# EasyEDA Pro project stopwatch.eprj, board PCB1
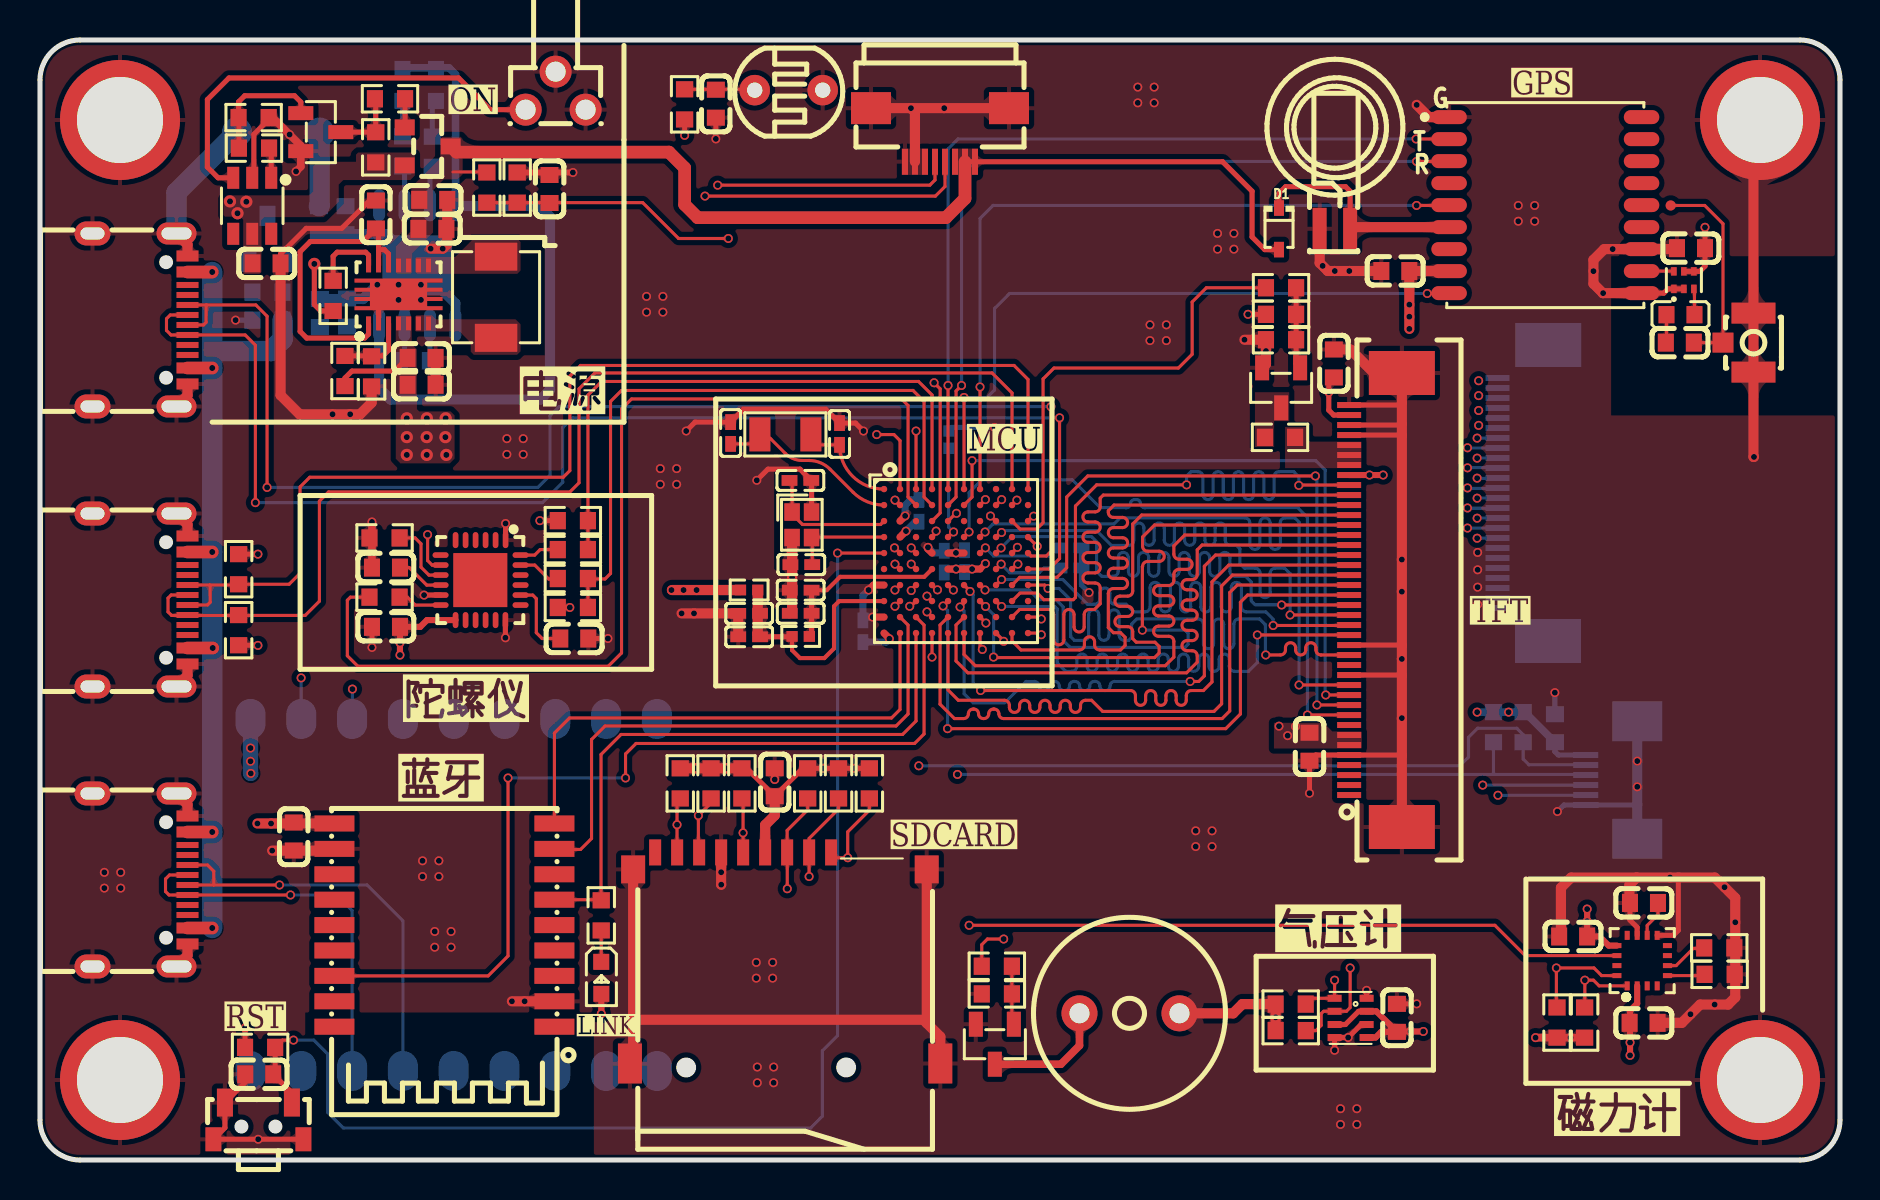
[diagram p3: board, top side]
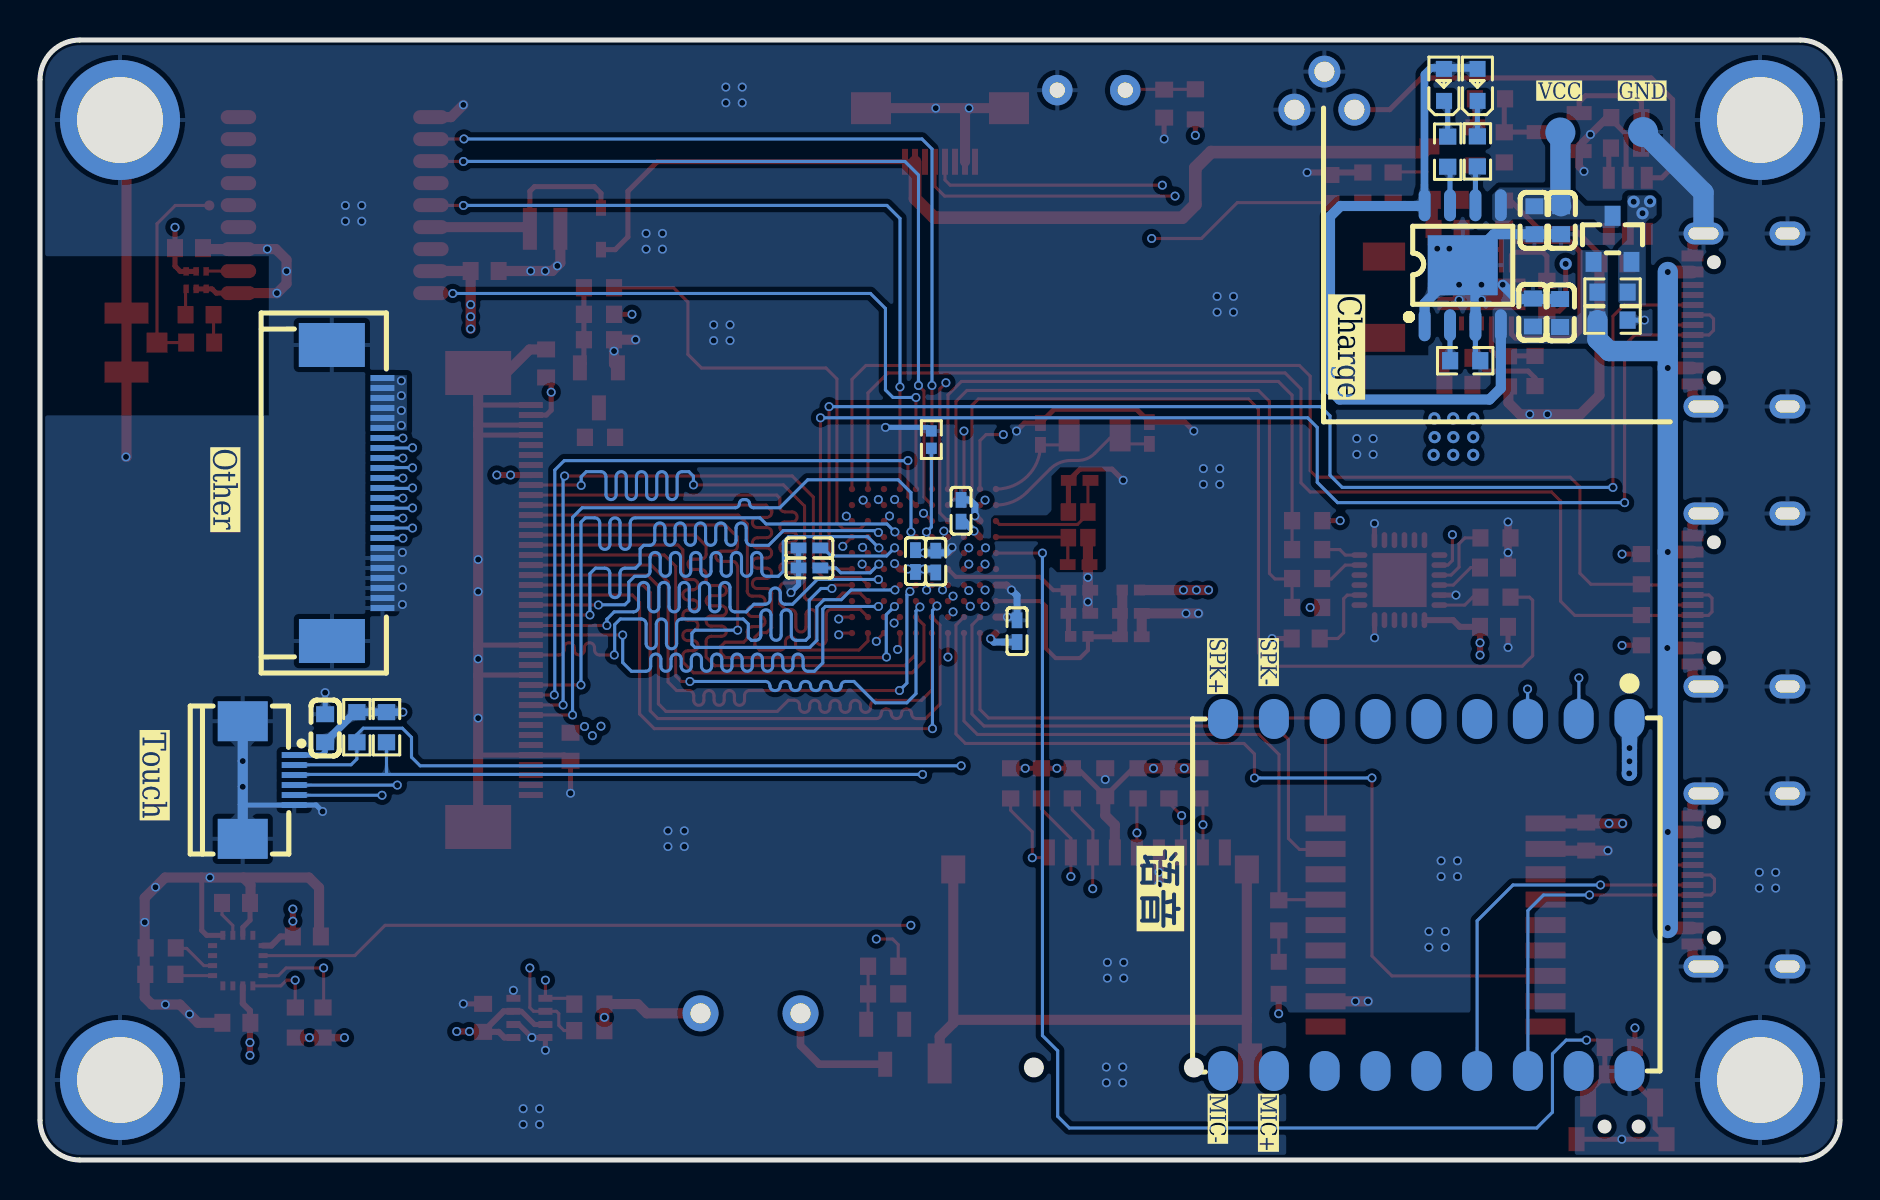
[diagram p4: board, bottom side, seen from below]

Outline 90 x 56 mm; copper layers: Top Layer, Inner1, Inner2, Inner3, Inner4, Bottom Layer. Coordinates in mm from the lower left corner of the outline.
Outline path: 0,54 0,2 arc(0.59,0.59) 2,0 88,0 arc(89.41,0.59) 90,2 90,54 arc(89.41,55.41) 88,56 2,56 arc(0.59,55.41) 0,54
Stack: Top Layer 0.035mm 外层铜厚1oz / Dielectric1 0.0994mm 3313 RC57% 4.2mil / Inner1 0.0152mm 内层铜厚 / Dielectric2 0.55mm 0.55mm H/H No copper / Inner2 0.0152mm 内层铜厚 / Dielectric3 0.1088mm 2116 RC54% 4.9mil / Inner3 0.0152mm 内层铜厚 / Dielectric4 0.55mm 0.55mm H/H No copper / Inner4 0.0152mm 内层铜厚 / Dielectric5 0.0994mm 3313 RC57% 4.2mil / Bottom Layer 0.035mm 外层铜厚1oz

## Design rules (mm)
template: 自定义配置
spacing copperThickness1oz (default): track to track 0.102, other pairs 0.089 to 0.3
spacing copperThickness2oz: track to track 0.203, other pairs 0.152 to 0.3
track width copperThickness1oz (default): min 0.102, default 0.155, max 2.54
track width copperThickness2oz: min 0.203, default 0.254, max 2.54
differential pair differentialPair (default): width min 0.127, default 0.254, max 2.54; gap min 0.152, default 0.152
via viaSize (default): diameter min 0.381, default 0.45, max 10; hole min 0.3, default 0.3, max 6.299
net FMC_NWE uses LCD
net FMC_NOE uses LCD
net FMC_D0 uses LCD
net FMC_D1 uses LCD
net FMC_D2 uses LCD
net FMC_D3 uses LCD
net FMC_D4 uses LCD
net FMC_D5 uses LCD
net FMC_D6 uses LCD
net FMC_D7 uses LCD
net FMC_D8 uses LCD
net FMC_D9 uses LCD
net FMC_D10 uses LCD
net FMC_D11 uses LCD
net FMC_D12 uses LCD
net FMC_D13 uses LCD
net FMC_D14 uses LCD
net FMC_D15 uses LCD
net FMC_NE1 uses LCD
net FMC_A16 uses LCD
net PB15 uses LCD
eq len grp LCD uses LCD

## Placement (name value [footprint] x y rotation side)
BUZZER1  3kHz  [BUZ-TH_BD9.6-P5.00-D0.7-FD]  54.47 7.33 180 top
C1  2.2uF  [C0402]  51.53 30.6 180 bottom
C2  2.2uF  [C0402]  51.53 29.6 0 bottom
C8  100nF  [C0402]  46.23 29.95 270 bottom
C9  100nF  [C0402]  43.95 32.46 270 bottom
C10  100nF  [C0402]  45.21 29.92 270 bottom
C11  100nF  [C0402]  41.15 26.44 270 bottom
C20  100nF  [C0603]  10.96 4.28 0 top
C21  20pF  [C0402]  39.98 36.3 90 top
C22  20pF  [C0402]  34.53 36.35 270 top
C23  20pF  [C0402]  38.02 33.98 0 top
C24  20pF  [C0402]  38.06 29.77 0 top
C25  100nF  [C0402]  38.03 28.49 0 top
C26  100nF  [C0402]  35.46 26.16 0 top
C27  2.5uF  [C0402]  38.03 27.33 0 top
C28  10uF  [C0402]  35.46 27.33 0 top
C35  100nF  [C0603]  17.3 29.62 0 top
C36  10uF  [C0603]  26.71 26.07 0 top
C37  100nF  [C0603]  17.3 26.66 0 top
C38  100nF  [C0603]  12.69 16.17 90 top
C39  100nF  [C0603]  64.69 39.83 270 top
C40  100nF  [C0603]  63.47 20.66 270 top
C41  100nF  [C0603]  75.74 21.59 270 bottom
C42  100nF  [C0603]  36.74 18.89 270 top
C94  100nF  [C0603]  11.33 44.83 180 top
C96  100nF  [C0603]  25.48 48.55 270 top
C97  100nF  [C0603]  33.79 52.82 90 top
C99  100nF  [C0603]  19.66 48.01 0 top
C100  10uF  [C0603]  19.62 46.56 0 top
C101  100nF  [C0603]  16.8 47.27 90 top
C102  100nF  [C0603]  19.08 38.76 0 top
C103  10uF  [C0603]  19.08 40.11 0 top
C104  100nF  [C0603]  15.28 46.99 90 bottom
C105  10uF  [C0603]  13.94 46.99 90 bottom
C106  100nF  [C0603]  14 42.35 270 bottom
C107  10uF  [C0603]  15.35 42.38 270 bottom
C108  100nF  [C0603]  67.77 44.45 0 top
C109  4.7uF  [C0603]  80.2 12.85 0 top
C110  100nF  [C0603]  67.84 7.11 270 top
C111  100nF  [C0603]  80.18 6.86 180 top
C112  100nF  [C0603]  76.66 11.18 0 top
C113  100nF  [C0603]  82.55 45.59 0 top
C114  470pF  [C0603]  81.99 40.87 180 top
CARD1  TF-01A  [TF-SMD_TF-01A]  37.26 10.1 0 top
CN1  SMTSOM330BTR  [M3-TH_BD6.0-D4.3]  4 52 0 top
CN2  SMTSOM330BTR  [M3-TH_BD6.0-D4.3]  86 52 0 top
CN3  SMTSOM330BTR  [M3-TH_BD6.0-D4.3]  4 4 0 top
CN4  SMTSOM330BTR  [M3-TH_BD6.0-D4.3]  86 4 0 top
D1  B5819WS  [SOD-323_L1.7-W1.3-LS2.5-FD]  61.95 46.56 90 top
FPC1  AFC07-S40ECA-00  [FPC-SMD_P0.50-40P_LCS-SJ-H2.0]  66.77 28 270 top
FPC2  FPC-05F-6PH20  [FPC-SMD_6P-P0.50_XUNPU_FPC-05F-6PH20]  78.58 19 270 bottom
FPC3  AFC01-S08FCA-00  [FPC-SMD_P0.50-8P_FGS-XJ-H2.0]  45 51.25 0 top
FPC4  AFC07-S24ECA-00  [FPC-SMD_AFC07-S24ECA-00]  74.14 33.35 270 bottom
L1  2.2uH  [IND-SMD_L4.4-W4.2]  22.8 43.14 270 top
L2  6.8nH  [L0603]  82.02 42.27 0 top
LED2  -  [LED_0603]  28.07 9.06 270 top
LED3  -  [LED_0603]  18.13 53.81 90 bottom
LED4  -  [LED_0603]  19.81 53.81 90 bottom
NOREF  -  [Pad_e4836]  81.53 47.73 0 top
Q1  SS8050  [SOT-23-3_L2.9-W1.3-P1.90-LS2.4-BR]  47.74 5.79 90 top
Q2  SS8050  [SOT-23-3_L2.9-W1.3-P1.90-LS2.4-BR]  62.06 38.61 90 top
Q3  AO3401A  [SOT-23_L2.9-W1.3-P1.90-LS2.4-BR]  19.38 50.68 180 top
Q4  AO3401A  [SOT-23_L2.9-W1.3-P1.90-LS2.4-BR]  11.37 46.06 270 bottom
R1  10K  [R0402]  45.43 36.02 270 bottom
R3  10kΩ  [R0603]  18.74 39.96 0 bottom
R4  10K  [R0603]  11 5.63 180 top
R5  10R  [R0402]  38.03 26.18 180 top
R6  10R  [R0402]  35.46 28.5 180 top
R8  10K  [R0603]  9.93 29.54 90 top
R10  10K  [R0603]  9.93 26.49 270 top
R17  10K  [R0603]  39.93 18.83 90 top
R18  10K  [R0603]  41.47 18.83 90 top
R19  10K  [R0603]  32.01 18.83 90 top
R20  10K  [R0603]  33.55 18.83 90 top
R21  120R  [R0603]  26.64 30.52 0 top
R22  120R  [R0603]  26.64 29.07 0 top
R23  4.7K  [R0603]  26.64 31.97 180 top
R24  4.7K  [R0603]  26.64 27.63 180 top
R25  10K  [R0603]  17.23 31.1 180 top
R27  2K  [R0603]  47.84 9.69 0 top
R28  10K  [R0603]  47.84 8.3 0 top
R29  120R  [R0603]  17.23 28.14 0 top
R30  10K  [R0603]  74.16 21.64 90 bottom
R31  10K  [R0603]  72.67 21.64 90 bottom
R32  2R2  [R0603]  62 36.13 0 top
R33  10K  [R0603]  62.05 42.28 180 top
R34  1K  [R0603]  62.05 43.61 0 top
R35  10K  [R0603]  62.05 41.01 0 top
R36  2K  [R0603]  28.06 12.23 270 top
R37  10K  [R0603]  38.38 18.83 90 top
R38  10K  [R0603]  35.09 18.83 90 top
R91  680R  [R0603]  19.61 50.42 90 bottom
R92  680R  [R0603]  18.13 50.43 90 bottom
R100  10K  [R0603]  16.79 50.63 270 top
R101  10K  [R0603]  10.68 52.12 180 top
R102  1K  [R0603]  10.7 50.6 180 top
R103  1K  [R0603]  17.5 53.06 180 top
R113  5K  [R0603]  22.34 48.62 270 top
R114  20K  [R0603]  23.86 48.62 270 top
R115  GL5528(10-20)  [RES-TH_L5.1-W4.3-P3.40-D0.5]  37.44 53.49 90 top
R116  1K  [R0603]  32.23 52.78 270 top
R122  0  [R0603]  11.37 43.39 180 bottom
R123  1M  [R0603]  14.66 43.21 90 top
R124  1M  [R0603]  15.25 39.45 270 top
R125  180K  [R0603]  16.58 39.43 90 top
R126  10kΩ  [R0603]  11.37 42 0 bottom
R127  4.7K  [R0603]  75.85 6.87 270 top
R128  4.7K  [R0603]  77.23 6.87 90 top
R129  4.7K  [R0603]  83.98 9.28 0 top
R130  4.7K  [R0603]  83.96 10.61 180 top
R131  4.7K  [R0603]  62.53 7.79 180 top
R132  4.7K  [R0603]  62.54 6.47 0 top
RF1  BWIPX-1-001E  [IPEX-SMD_BWIPX-1-001E]  84.91 40.87 0 top
SW2  TS24CA 250gf 013  [SW-SMD_L4.7-W3.5-P3.35-EH]  10.92 1.95 180 top
SW4  GT-TCB73B-H090-L1  [SW-TH_G-SWITCH_GT-TCB73B-H090-L1]  25.78 53.47 180 top
TP10  -  [Test-Point-0.5mm]  13.98 51.37 180 bottom
TP11  -  [Test-Point-0.5mm]  9.85 51.4 180 bottom
U1  STM32H743VIH6  [BGA-100_L8.0-W8.0-P0.80-R10-C10-BL]  45.8 29.95 270 top
U3  RC6621A  [BULETM-SMD_18P-L15.2-W11.2-P1.27]  20.22 11.75 180 top
U4  MPU-6050  [QFN-24_L4.0-W4.0-P0.50-BL-EP2.7]  22.03 29 180 top
U11  TP4056X-42-ESOP8  [SOP-8_L4.9-W3.9-P1.27-LS6.0-TL-EP]  18.86 44.74 90 bottom
U23  SS8050  [SOT-23-3_L2.9-W1.3-P1.90-LS2.4-BR]  14.04 51.39 180 top
U24  -  [SOT-23-6_L2.9-W1.6-P0.95-LS2.7-BR]  10.61 47.71 90 top
U26  -  [ASRPRO_CORE]  10.53 22.05 270 bottom
U29  TPS63020DSJR  [VSON-14_L4.0-W3.0-P0.50-BL-EP_TI_DSJ]  17.93 43.28 0 top
U30  ATGM336H-5N31  [GPSM-SMD_ATGM336H-TR]  75.27 47.74 90 top
U31  MS621FE-FL11E  [BAT-SMD_FL11E]  64.74 46.56 270 top
U32  IST8310  [LGA-16_L3.0-W3.0-P0.50-BL_SQ]  80.11 9.97 0 top
U33  DPS310  [LGA-8_DPS310XTSA1]  65.53 7.1 180 top
U34  AT2659  [DFN-6_L1.6-W1.0-P0.55-BL]  82.19 43.99 0 top
USB1  TYPE-C 16PIN 2MD(073)  [USB-C-SMD_TYPE-C-6PIN-2MD-073]  5 28 270 top
USB2  TYPE-C 16PIN 2MD(073)  [USB-C-SMD_TYPE-C-6PIN-2MD-073]  5 42 270 top
USB3  TYPE-C 16PIN 2MD(073)  [USB-C-SMD_TYPE-C-6PIN-2MD-073]  5 14 270 top
X2  32.768kHz  [OSC-SMD_L3.2-W1.5]  37.27 36.28 0 top
X3  24MHz  [CRYSTAL-SMD_4P-L2.0-W1.6-BL-A]  38.09 31.76 270 top

## Footprints (pads in the part's own frame, mm; a bottom-side part is the same pattern mirrored in y, then rotated)
ASRPRO_CORE
  oval 2x1.5 smd: 1(0,0) 2(0,-2.54) 3(0,-5.08) 4(0,-7.62) 5(0,-10.16) 6(0,-12.7) 7(0,-15.24) 8(0,-17.78) 9(0,-20.32) 10(17.6,-20.32) 11(17.6,-17.78) 12(17.6,-15.24) 13(17.6,-12.7) 14(17.6,-10.16) 15(17.6,-7.62) 16(17.6,-5.08) 17(17.6,-2.54) 18(17.6,0)
BAT-SMD_FL11E
  rect 2.1x0.7 smd: 1(0,0.762) 2(0,-0.762)
BGA-100_L8.0-W8.0-P0.80-R10-C10-BL
  round 0.32 smd: A1(-3.6,-3.6) A2(-3.6,-2.8) A3(-3.6,-2) A4(-3.6,-1.2) A5(-3.6,-0.4) A6(-3.6,0.4) A7(-3.6,1.2) A8(-3.6,2) A9(-3.6,2.8) A10(-3.6,3.6) B1(-2.8,-3.6) B2(-2.8,-2.8) B3(-2.8,-2) B4(-2.8,-1.2) B5(-2.8,-0.4) B6(-2.8,0.4) B7(-2.8,1.2) B8(-2.8,2) B9(-2.8,2.8) B10(-2.8,3.6) C1(-2,-3.6) C2(-2,-2.8) C3(-2,-2) C4(-2,-1.2) C5(-2,-0.4) C6(-2,0.4) C7(-2,1.2) C8(-2,2) C9(-2,2.8) C10(-2,3.6) D1(-1.2,-3.6) D2(-1.2,-2.8) D3(-1.2,-2) D4(-1.2,-1.2) D5(-1.2,-0.4) D6(-1.2,0.4) D7(-1.2,1.2) D8(-1.2,2) D9(-1.2,2.8) D10(-1.2,3.6) E1(-0.4,-3.6) E2(-0.4,-2.8) E3(-0.4,-2) E4(-0.4,-1.2) E5(-0.4,-0.4) E6(-0.4,0.4) E7(-0.4,1.2) E8(-0.4,2) E9(-0.4,2.8) E10(-0.4,3.6) F1(0.4,-3.6) F2(0.4,-2.8) F3(0.4,-2) F4(0.4,-1.2) F5(0.4,-0.4) F6(0.4,0.4) F7(0.4,1.2) F8(0.4,2) F9(0.4,2.8) F10(0.4,3.6) G1(1.2,-3.6) G2(1.2,-2.8) G3(1.2,-2) G4(1.2,-1.2) G5(1.2,-0.4) G6(1.2,0.4) G7(1.2,1.2) G8(1.2,2) G9(1.2,2.8) G10(1.2,3.6) H1(2,-3.6) H2(2,-2.8) H3(2,-2) H4(2,-1.2) H5(2,-0.4) H6(2,0.4) H7(2,1.2) H8(2,2) H9(2,2.8) H10(2,3.6) J1(2.8,-3.6) J2(2.8,-2.8) J3(2.8,-2) J4(2.8,-1.2) J5(2.8,-0.4) J6(2.8,0.4) J7(2.8,1.2) J8(2.8,2) J9(2.8,2.8) J10(2.8,3.6) K1(3.6,-3.6) K2(3.6,-2.8) K3(3.6,-2) K4(3.6,-1.2) K5(3.6,-0.4) K6(3.6,0.4) K7(3.6,1.2) K8(3.6,2) K9(3.6,2.8) K10(3.6,3.6)
BULETM-SMD_18P-L15.2-W11.2-P1.27
  rect 2x0.8 smd: 1(-5.5,5.08) 2(-5.5,3.81) 3(-5.5,2.54) 4(-5.5,1.27) 5(-5.5,0) 6(-5.5,-1.27) 7(-5.5,-2.54) 8(-5.5,-3.81) 9(-5.5,-5.08) 10(5.5,-5.08) 11(5.5,-3.81) 12(5.5,-2.54) 13(5.5,-1.27) 14(5.5,0) 15(5.5,1.27) 16(5.5,2.54) 17(5.5,3.81) 18(5.5,5.08)
BUZ-TH_BD9.6-P5.00-D0.7-FD
  round 1.8 hole 1: 1(-2.5,0) 2(2.5,0)
C0402
  rect 0.79x0.54 smd: 1(-0.545,0) 2(0.545,0)
C0603
  rect 0.8x0.9 smd: 1(-0.7,0) 2(0.7,0)
CRYSTAL-SMD_4P-L2.0-W1.6-BL-A
  rect 0.875x0.775 smd: 1(-0.638,-0.488) 2(0.638,-0.488) 3(0.638,0.488) 4(-0.638,0.488)
DFN-6_L1.6-W1.0-P0.55-BL
  rect 0.28x0.425 smd: 1(-0.5,-0.438) 2(0,-0.438) 3(0.5,-0.438) 4(0.5,0.438) 5(0,0.438) 6(-0.5,0.438)
FPC-SMD_6P-P0.50_XUNPU_FPC-05F-6PH20
  rect 0.3x1.25 smd: 1(-1.25,1.288) 2(-0.75,1.288) 3(-0.25,1.288) 4(0.25,1.288) 5(0.75,1.288) 6(1.25,1.288)
  rect 2x2.5 smd: 7(2.94,-1.288) 8(-2.94,-1.288)
FPC-SMD_AFC07-S24ECA-00
  rect 0.3x1.2 smd: 1(-5.75,1.266) 2(-5.25,1.266) 3(-4.749,1.266) 4(-4.252,1.266) 5(-3.751,1.266) 6(-3.251,1.266) 7(-2.75,1.266) 8(-2.25,1.266) 9(-1.75,1.266) 10(-1.25,1.266) 11(-0.75,1.266) 12(-0.251,1.266) 13(0.249,1.266) 14(0.75,1.266) 15(1.25,1.266) 16(1.75,1.266) 17(2.25,1.266) 18(2.749,1.266) 19(3.249,1.266) 20(3.749,1.266) 21(4.25,1.266) 22(4.75,1.266) 23(5.251,1.266) 24(5.75,1.266)
  rect 2.2x3.3 smd: 25(-7.401,-1.266) 26(7.401,-1.26)
FPC-SMD_P0.50-8P_FGS-XJ-H2.0
  rect 0.3x1.3 smd: 1(-1.75,-1.34) 2(-1.252,-1.339) 3(-0.75,-1.34) 4(-0.25,-1.34) 5(0.25,-1.34) 6(0.75,-1.34) 7(1.25,-1.34) 8(1.75,-1.34)
  rect 2x1.6 smd: 9(3.45,1.34) 10(-3.45,1.34)
FPC-SMD_P0.50-40P_LCS-SJ-H2.0
  rect 0.3x1.2 smd: 1(9.751,-1.318) 2(9.252,-1.318) 3(8.753,-1.318) 4(8.252,-1.318) 5(7.752,-1.318) 6(7.252,-1.318) 7(6.752,-1.318) 8(6.251,-1.318) 9(5.753,-1.318) 10(5.253,-1.318) 11(4.753,-1.318) 12(4.252,-1.318) 13(3.752,-1.318) 14(3.251,-1.318) 15(2.752,-1.318) 16(2.253,-1.318) 17(1.752,-1.318) 18(1.252,-1.318) 19(0.752,-1.318) 20(0.252,-1.318) 21(-0.249,-1.318) 22(-0.748,-1.318) 23(-1.247,-1.318) 24(-1.748,-1.318) 25(-2.248,-1.318) 26(-2.748,-1.318) 27(-3.248,-1.318) 28(-3.749,-1.318) 29(-4.247,-1.318) 30(-4.747,-1.318) 31(-5.247,-1.318) 32(-5.748,-1.318) 33(-6.248,-1.318) 34(-6.749,-1.318) 35(-7.248,-1.318) 36(-7.747,-1.318) 37(-8.248,-1.318) 38(-8.748,-1.318) 39(-9.248,-1.318) 40(-9.748,-1.318)
  rect 2.2x3.3 smd: 41(11.35,1.318) 42(-11.35,1.318)
GPSM-SMD_ATGM336H-TR
  oval 0.7x1.773 smd: 1(4.4,4.811) 2(3.3,4.811) 3(2.2,4.811) 4(1.1,4.811) 5(0,4.811) 6(-1.1,4.811) 7(-2.2,4.811) 8(-3.3,4.811) 9(-4.4,4.811) 10(-4.4,-4.811) 11(-3.3,-4.811) 12(-2.2,-4.811) 13(-1.1,-4.811) 14(0,-4.811) 15(1.1,-4.811) 16(2.2,-4.811) 17(3.3,-4.811) 18(4.4,-4.811)
IND-SMD_L4.4-W4.2
  rect 1.4x2.12 smd: 1(2.028,0) 2(-2.028,0)
IPEX-SMD_BWIPX-1-001E
  rect 1.05x1 smd: 1(-0.762,0)
  rect 2.2x1.05 smd: 2(0.762,-1.475) 3(0.762,1.475)
L0603
  rect 0.8x0.864 smd: 1(-0.7,0) 2(0.7,0)
LED_0603
  rect 0.8x0.8 smd: 1(-0.851,-0.01) 2(0.75,-0.005)
LGA-8_DPS310XTSA1
  rect 0.7x0.35 smd: 1(0.8,0.981) 2(0.8,0.33) 3(0.8,-0.33) 4(0.8,-0.981) 5(-0.8,-0.981) 6(-0.8,-0.33) 7(-0.8,0.33) 8(-0.8,0.981)
LGA-16_L3.0-W3.0-P0.50-BL_SQ
  rect 0.25x0.45 smd: 1(-0.75,-1.263) 2(-0.25,-1.263) 3(0.25,-1.263) 4(0.75,-1.263) 9(0.75,1.263) 10(0.25,1.263) 11(-0.25,1.263) 12(-0.75,1.263)
  rect 0.45x0.25 smd: 5(1.263,-0.75) 6(1.263,-0.25) 7(1.263,0.25) 8(1.263,0.75) 13(-1.263,0.75) 14(-1.263,0.25) 15(-1.263,-0.25) 16(-1.263,-0.75)
M3-TH_BD6.0-D4.3
  round 6 hole 4.3x3.5: 1(0,0)
OSC-SMD_L3.2-W1.5
  rect 1.05x1.7 smd: 1(-1.275,0) 2(1.275,0)
Pad_e4836
  round 0.508 smd: 1(0,0)
QFN-24_L4.0-W4.0-P0.50-BL-EP2.7
  oval 0.28x0.8 smd: 1(-1.25,-2) 2(-0.75,-2) 3(-0.25,-2) 4(0.25,-2) 5(0.75,-2) 6(1.25,-2) 13(1.25,2) 14(0.75,2) 15(0.25,2) 16(-0.25,2) 17(-0.75,2) 18(-1.242,2)
  oval 0.8x0.28 smd: 7(2,-1.25) 8(2,-0.75) 9(2,-0.25) 10(2,0.25) 11(2,0.75) 12(2,1.25) 19(-2,1.25) 20(-2,0.75) 21(-2,0.25) 22(-2,-0.25) 23(-2,-0.75) 24(-2,-1.25)
  rect 2.7x2.7 smd: 25(0.013,0)
R0402
  rect 0.566x0.54 smd: 1(-0.433,0) 2(0.433,0)
R0603
  rect 0.806x0.864 smd: 1(-0.753,0) 2(0.753,0)
RES-TH_L5.1-W4.3-P3.40-D0.5
  round 1.524 hole 0.762: 1(0,1.7) 2(0,-1.7)
SOD-323_L1.7-W1.3-LS2.5-FD
  rect 0.78x0.5 smd: 1(-1.04,0) 2(1.04,0)
SOP-8_L4.9-W3.9-P1.27-LS6.0-TL-EP
  oval 1.6x0.6 smd: 1(-3,1.905) 2(-3,0.635) 3(-3,-0.635) 4(-3,-1.905) 5(3,-1.905) 6(3,-0.635) 7(3,0.635) 8(3,1.905)
  rect 3x3.5 smd: 9(0,0)
SOT-23-3_L2.9-W1.3-P1.90-LS2.4-BR
  rect 1.25x0.7 smd: 1(1,-0.95) 2(1,0.95) 3(-1,0)
SOT-23-6_L2.9-W1.6-P0.95-LS2.7-BR
  rect 1.1x0.6 smd: 1(1.4,-0.95) 2(1.4,0) 3(1.4,0.95) 4(-1.4,0.95) 5(-1.4,0) 6(-1.4,-0.95)
SOT-23_L2.9-W1.3-P1.90-LS2.4-BR
  rect 1x0.8 smd: 1(1.15,-0.95) 2(1.15,0.95) 3(-1.15,0)
SW-SMD_L4.7-W3.5-P3.35-EH
  rect 0.8x1.4 smd: 1(-1.675,-0.917) 2(1.675,-0.917)
  rect 0.8x1.2 smd: 3(-2.25,0.917) 4(2.25,0.917)
SW-TH_G-SWITCH_GT-TCB73B-H090-L1
  round 1.6 hole 1: 1(-1.5,0.95) 2(1.5,0.95) 3(0,-0.95)
Test-Point-0.5mm
  round 1.5 smd: 1(0,0)
TF-SMD_TF-01A
  rect 0.6x1.3 smd: 1(2.3,5.276) 2(1.2,5.276) 3(0.101,5.276) 4(-1,5.276) 5(-2.099,5.276) 6(-3.2,5.276) 7(-4.3,5.276) 8(-5.399,5.276) 9(-6.5,5.276)
  rect 1.2x1.4 smd: 10(-7.599,4.426) 13(7.08,4.426)
  rect 1.2x2 smd: 11(-7.76,-5.276) 12(7.76,-5.276)
USB-C-SMD_TYPE-C-6PIN-2MD-073
  rect 0.55x1.1 smd: 1(-3.2,2.375) 2(-2.4,2.375) 11(2.4,2.375) 12(3.2,2.375)
  rect 0.3x1.1 smd: 3(-1.75,2.375) 4(-1.25,2.375) 5(-0.75,2.375) 6(-0.25,2.375) 7(0.25,2.375) 8(0.75,2.375) 9(1.25,2.375) 10(1.75,2.375)
  oval 1.1x2 hole 0.6x1.5: 13(-4.325,1.825) 14(4.325,1.825)
  oval 1.2x1.8 hole 0.6x1.2: 13(-4.325,-2.375) 14(4.325,-2.375)
VSON-14_L4.0-W3.0-P0.50-BL-EP_TI_DSJ
  rect 0.25x0.7 smd: 1(-1.5,-1.45) 2(-1,-1.45) 3(-0.5,-1.45) 4(0,-1.45) 5(0.5,-1.45) 6(1,-1.45) 7(1.5,-1.45) 8(1.5,1.45) 9(1,1.45) 10(0.5,1.45) 11(0,1.45) 12(-0.5,1.45) 13(-1,1.45) 14(-1.5,1.45)
  custom 4.4x1.58 smd: 15(0,0)

## Nets
As in the schematic, except:
$2N13946: C114.1 NOREF.1 RF1.1

Pads without a net: CARD1 9; FPC1 1 2 3 4 8 14; U1 A8 B10 C3 C6 C7 D3 D9 F1 H10 J8; U3 1 3 4 5 7 12 13 14 15 17 18; U4 2 3 4 5 6 7 14 15 16 17 19 21 22 25; U24 4 6; U26 4 5 6 7 8 9 10 11 12 13 14 17; U30 4 7 13 14 15 16 17 18; U32 3 4 7 8 12 15; USB1 3 4 9 10; USB2 3 4 9 10; USB3 3 4 9 10

## Via types
v1: diameter 0.61, hole 0.305, Top Layer to Bottom Layer, 19 vias
v2: diameter 0.45, hole 0.299, Top Layer to Bottom Layer, 300 vias

## Routing (per net, layer and track width the routed paths; a pad name or vN(x,y) marks a point on that pad's centre or on a via; arc(x,y) is an arc through that point)
5V: length 51.1
  Top Layer w0.155: R113.1 22.31,49.4 20.65,49.4
  Top Layer w0.254: D1.1 61.24,45.52 60.6,46.15 60.6,48.44 59.13,49.91 FPC3.8 FPC3.7
  Top Layer w0.635: FPC3.7 46.25,48.08 45.29,47.12 32.89,47.12 32.23,47.77 32.23,49.61 31.44,50.39 20.82,50.39 Q3.3
+5V:
  vias: v1(9.5,47.93) v1(9.88,47.34) v1(10.32,47.91)
GND: length 297.1
  Top Layer w0.254: v2(41.17,36.45) 40.78,36.85 C21.2 39.28,37.54 35.18,37.54 C22.1 32.76,36.9 v2(32.31,36.45) ; U30.10 81.19,43.34 81.4,43.56 U34.1 U34.2 ; FPC1.13 68.08,24.25 68.09,24.24 ; U29.15 17.04,43.28 16.93,43.17 U29.2 ; 68.09,25.74 68.09,25.75 FPC1.16 ; FPC1.38 68.04,36.75 68.09,36.8 ; C94.1 12.03,45.3 13.31,46.58 15.09,46.58 16.48,47.97 C101.2 ; v2(64.73,5.49) U33.1 v2(65.41,6.12) 66.06,6.77 U33.7 ; 66.33,8.08 v2(66.33,8.48) ; 63.47,19.94 v2(63.47,18.34) ; 63.47,19.94 C40.2 ; 63.47,19.94 63.78,20.25 FPC1.5 68.08,20.25 68.09,20.23 ; C20.1 10.26,3.89 SW2.2 9.25,1.61 SW2.4 v2(10.91,1.04) SW2.3 ; U4.1 v2(23.28,31.83) ; C37.1 v2(16.6,25.63) ; C97.1 v2(33.79,51.05) ; U4.11 19.2,28.25 ; v2(35.84,33.98) 36.4,34.54 38,34.54 C23.2 38.58,33.96 X3.4 ; FPC1.40 67.99,37.75 68.09,37.85 ; FPC1.37 68.09,36.25 68.09,36.24 ; C110.1 v2(68.83,7.81) ; U24.2 10.69,49.19 10.69,51.28 11.44,52.02 R101.1 ; U32.9 81.67,11.23 81.91,11.48 81.91,14.11 81.92,14.12 ; U32.11 79.86,11.63 79.5,11.99 C109.1 ; U4.18 v2(23.27,26.11) ; C36.2 v2(28.4,26.07)
  Top Layer w0.305: R114.1 v2(26.64,49.38)
  Top Layer w0.355: 45.4,30.35 U1.E6 ; v2(41.43,28.5) 41.68,28.75 U1.G1 ; U1.J1 v2(41.63,27.15) ; v2(43.26,32.21) 43.26,32.2 43,31.95 ; v2(44.4,30.63) 44.4,30.55 U1.E4
  Top Layer w0.381: C42.1 v2(36.74,19.02) ; C35.1 v2(16.6,30.37) v2(16.6,31.9) ; v2(12.8,49.43) 13.04,49.67 U23.2 13.04,50.71 v2(12.48,51.27) 11.63,52.12 R101.1
  Top Layer w0.508: 29.66,7.01 44.17,7.01 44.34,6.84 ; 29.66,7.01 29.66,4.99 CARD1.11 ; 29.66,7.01 29.66,14.53 ; U3.2 v2(24.23,7.94) v2(23.6,7.94) ; Q2.2 61.3,39.8 v2(61.3,40.45) 61.3,41.01 v2(60.22,41.01) ; C111.1 82.09,6.86 v2(82.52,7.29) 83.01,7.77 v2(83.73,7.77) 84.4,7.77 84.76,8.13 v2(84.76,11.89) 84.76,13.1 v2(84.23,13.64) 83.74,14.12 v2(81.5,14.12) 79.83,14.12 ; USB3.1 7.38,17.78 USB3.13 ; 75.96,11.18 76.05,11.27 76.05,13.61 76.56,14.12 79.83,14.12 ; USB2.1 7.38,45.78 USB2.13 ; FPC3.10 v2(43.55,52.59) ; v2(43.55,52.59) v2(45.21,52.59) FPC3.9 ; v2(43.55,52.59) 43.75,52.39 FPC3.2 ; U31.2 63.98,44.86 64.39,44.45 v2(64.74,44.45) v2(65.47,44.45) C108.1 ; 79.83,14.12 79.47,13.76 79.47,12.88 C109.1 ; CN2.1 85.67,51.67 RF1.3 RF1.2 85.67,35.15 v2(85.7,35.15) ; C26.1 C28.1 v2(32.7,27.33) v2(32.08,27.33) ; FPC1.41 v2(68.09,22.09) v2(68.09,25.05) v2(68.09,28.42) v2(68.09,30.02) FPC1.42 66.69,39.35 65.52,40.53 C39.1 ; C99.2 20.36,45.79 v2(20.14,45.57) v2(19.53,45.57) ; USB3.14 7.38,10.23 USB3.12 ; v2(11.61,15.47) 14.63,15.47 U3.11 ; USB1.14 7.38,24.22 USB1.12 ; CARD1.13 44.34,6.84 ; 44.34,6.84 45.02,6.16 CARD1.12 ; X3.2 v2(37.6,29.13) v2(37.6,27.9) 37.6,27.45 C27.1 ; C103.2 C102.2 ; USB2.14 7.38,38.23 USB2.12 ; C94.1 12.03,38.24 12.98,37.29 v2(14.63,37.29) v2(15.51,37.29) 16,37.29 16.58,37.86 R125.1 ; C113.1 81.8,45.54 U30.12 v2(78.63,45.54) 78.21,45.54 77.67,45.01 v2(77.67,44.44) 77.67,43.81 78.14,43.34 v2(78.16,43.34) U30.10 ; 34.06,15.38 v2(34.06,14.39) 34.06,13.77 v2(34.06,13.77) ; U30.1 69.45,52.14 v2(68.83,52.76) ; USB1.1 7.38,31.78 USB1.13
  Bottom Layer w0.254: v2(75.87,17.42) 76.19,17.75 FPC2.6 79.84,17.75 79.86,17.77 ; v2(52.45,28.37) 52.07,28.75 C2.2 C1.1 ; v2(47.73,36.63) 45.61,36.63 R1.1 ; R126.1 v2(9.78,42) ; C41.1 v2(75.74,23.37) ; R3.1 18.23,40.2 U11.3
  Bottom Layer w0.355: v2(44.4,30.63) 44.68,30.36 v2(45.8,30.36) 46.09,30.36 C8.1 ; v2(43.26,32.21) 43.26,32.74 43.52,33.01 C9.1 ; v2(41.43,28.5) 41.15,28.22 C11.1 41.31,27.15 v2(41.63,27.15)
  Bottom Layer w0.508: C105.1 C104.1 17.31,46.29 U11.9 20.77,42.83 U11.1 ; FPC2.8 v2(79.86,19.95) v2(79.86,18.66) FPC2.7 ; C106.1 16.15,43.05 v2(16.87,43.76) ; v2(17.93,43.76) 18.23,43.46 U11.3
  Bottom Layer w1.016: USB2.13 6.83,48.37 TP11.1
  vias: v2(3.22,14.38) v2(3.22,13.59) v2(4.03,14.38) v2(4.03,13.59) v2(17.93,43) v2(19.05,43.76) v2(19.05,43) v2(19.13,14.96) v2(19.13,14.17) v2(19.2,28.25) v2(19.74,11.43) v2(19.74,10.64) v2(19.94,14.96) v2(19.94,14.17) v2(20.55,11.43) v2(20.55,10.64) v2(23.34,36.07) v2(23.34,35.28) v2(24.16,36.07) v2(24.16,35.28) v2(30.33,43.18) v2(30.33,42.39) v2(31.01,34.57) v2(31.01,33.78) v2(31.15,43.18) v2(31.15,42.39) v2(31.83,34.57) v2(31.83,33.78) v2(35.81,9.88) v2(35.81,9.09) v2(35.87,4.65) v2(35.87,3.86) v2(36.63,9.88) v2(36.63,9.09) v2(36.68,4.65) v2(36.68,3.86) v2(54.89,53.64) v2(54.89,52.86) v2(55.5,41.76) v2(55.5,40.97) v2(55.71,53.64) v2(55.71,52.86) v2(56.32,41.76) v2(56.32,40.97) v2(57.78,16.46) v2(57.78,15.67) v2(58.6,16.46) v2(58.6,15.67) v2(58.88,46.33) v2(58.88,45.54) v2(59.7,46.33) v2(59.7,45.54) v2(64.13,44.71) v2(65.02,2.57) v2(65.02,1.78) v2(65.84,2.57) v2(65.84,1.78) v2(71.88,30.38) v2(71.88,29.51) v2(71.88,28.64) v2(71.88,27.77) v2(73.91,47.73) v2(73.91,46.94) v2(74.73,47.73) v2(74.73,46.94)
VBAT: length 3.7
  Bottom Layer w1.016: C105.2 13.98,47.73 TP10.1
VBUS: length 80
  Top Layer w0.635: USB3.11 v1(8.61,11.6) ; USB1.11 v1(8.64,25.6) ; USB1.2 v1(8.61,30.4) ; 7.38,39.6 v1(8.61,39.6) ; USB3.2 v1(8.61,16.4) ; v1(8.61,44.4) 7.38,44.4
  Bottom Layer w0.381: U11.8 20.78,47.75 20.78,54.28 20.45,54.61 18.13,54.61
  Bottom Layer w0.508: U11.8 20.81,47.7 24.97,47.7 25.5,47.17 25.5,38.51 25.02,38.02 17.53,38.02 16.96,38.59 U11.4
  Bottom Layer w1.016: 8.61,40.45 11.54,40.45 12.13,41.03 R126.2 ; 8.61,40.45 v1(8.61,39.6) v1(8.61,30.4) v1(8.61,16.4) v1(8.61,11.6) ; 8.61,40.45 v1(8.61,44.4)
VCC3V3: length 92
  Top Layer w0.155: v2(19.38,31.27) 19.38,29.97 19.61,29.75 U4.8
  Top Layer w0.203: v2(42.75,32.99) 42.75,32.99 43,32.75
  Top Layer w0.254: R38.2 35.34,19.58 C42.2 38.13,19.58 R37.2 v2(39.16,19.58) R17.2 v2(40.74,19.58) R18.2 ; U34.5 U34.4 82.99,44.43 83.25,44.69 C113.2 v2(83.25,46.63) ; R124.2 15.25,39.1 15.6,39.45 17.72,39.45 C103.1 ; v1(13.72,44.81) 13.72,42.77 14.04,42.45 R123.1 ; 9.93,25.74 10.89,25.74 v2(10.9,25.73) ; R116.2 32.23,52.02 v2(32.23,51.23) ; FPC1.39 64.68,37.25 64.44,37.49 v2(64.44,38.39) 64.44,38.87 C39.2 ; R24.2 v2(26.49,27.63) ; 10.25,5.63 v2(10.25,6.6) ; R23.2 v2(24.99,31.97) ; R8.2 v2(10.9,30.29) ; U33.2 65.27,6.77 65.93,7.44 66.33,7.44 ; 61.3,42.28 v2(60.4,42.28)
  Top Layer w0.305: C110.2 67.06,6.41 66.78,6.12 U33.8 ; C110.2 66.82,7.44 66.33,7.44 ; C110.2 67.86,6.43 v2(68.53,6.43) v2(69.16,6.43) ; v2(79.5,5.23) v2(79.5,5.88) 79.5,7.47 79.86,7.83 U32.2 ; v2(18,25.25) v2(18,25.86) C37.2 19.01,26.66 19.35,27 U4.13 ; U32.13 78.43,10.72 77.98,11.18 C112.2 v2(77.36,11.94) v2(77.36,12.55) ; 47,29.55 47.27,29.81 v2(47.27,29.82) ; v2(67.16,34.25) v2(66.47,34.25) FPC1.33 ; 28.07,8.31 v2(28.07,7.31)
  Top Layer w0.355: U1.K1 42.47,26.08 v2(42.47,26.06) ; 47,29.55 v2(46.61,29.55) U1.F6 v2(45.8,29.55) 45.4,29.55 ; 43,31.15 v2(43.3,31.44)
  Top Layer w0.381: R128.1 v2(76.53,6.12) R127.2 v2(74.78,6.12)
  Top Layer w0.508: R6.2 v2(32.83,28.5) v2(32.18,28.5) 31.6,28.5 ; U3.10 v2(11.55,16.83) v2(10.87,16.83) ; U30.8 70.45,44.45 68.47,44.45 v2(68.47,42.77) v2(68.47,42.17) v2(68.47,41.55) ; R19.2 v2(32.79,19.58) R20.2 v2(34.33,19.58) R38.2 ; BUZZER1.1 59.66,7.33 60.12,7.79 R131.2 v2(61.78,7.13) 61.78,6.47 R132.1 ; 36.26,15.38 36.26,16.75 36.74,17.23 C42.2
  Bottom Layer w0.254: FPC2.1 75.92,20.25 75.74,20.42 C41.2
  Bottom Layer w0.355: C9.2 43.77,31.92 v2(43.3,31.44) ; C11.2 42.3,25.9 v2(42.47,26.06) ; C10.2 45.38,29.55 v2(45.8,29.55) 46.23,29.55
  Bottom Layer w0.381: C41.2 74.24,22.39 R30.2 v2(73.43,22.39) R31.2 v2(71.86,22.39)
  Bottom Layer w0.762: U26.1 v2(10.53,20.6) v2(10.53,19.94) 10.53,19.34 v2(10.54,19.33)
  vias: v1(18.34,37.08) v1(18.34,36.14) v1(18.34,35.25) v1(19.34,37.08) v1(19.33,36.14) v1(19.34,35.25) v1(20.28,37.08) v1(20.27,36.14) v1(20.32,35.25) v2(31.57,28.5) v2(61.95,21.69) v2(62.38,21.22) v2(62.77,21.67) v2(71.93,38.96) v2(71.93,38.22) v2(71.93,37.48) v2(71.93,36.73)
VDDA: length 11.9
  Top Layer w0.203: U1.H1 39.96,27.95 39.7,27.69 39.7,25.58 39.22,25.09 38,25.09 37.6,25.49 37.6,26.18
  Top Layer w0.254: 37.6,26.18 37.58,26.16 C26.2
  Top Layer w0.508: C26.2 35.89,26.27 R6.1
BLUE_BRTS: length 46.4
  Top Layer w0.155: v2(23.4,19.1) 23.4,10.2 22.41,9.21 U3.16 ; v2(29.28,19.1) 29.28,20.3 29.8,20.83 43.73,20.83 44.2,21.3 44.2,26.75 U1.J3
  Bottom Layer w0.155: v2(23.4,19.1) v2(29.28,19.1)
BLUE_LINK: length 30.5
  Top Layer w0.155: 28.05,13 R36.1 ; 28.05,13 28.05,20.28 29.05,21.28 43.13,21.28 43.8,21.95 U1.K3 ; 28.05,13 28.03,13.02 U3.6
BLUE_RX: length 28.4
  Top Layer w0.155: 43,27.15 43.4,26.75 43.4,22.3 42.8,21.7 28.25,21.7 27.58,21.03 27.58,16.08 27.03,15.53 25.75,15.53 U3.8
BLUE_TX: length 26.1
  Top Layer w0.155: U3.9 25.72,21.34 26.48,22.1 42.58,22.1 43,22.53 43,26.35
BUZZER: length 17.7
  Top Layer w0.155: U1.K8 48.18,25.96 v2(48.18,25.93) ; R27.1 47.09,10.77 47.37,11.05 v2(48.18,11.05)
  Inner3 w0.155: v2(48.18,25.93) v2(48.18,11.05)
CHRG: length 2
  Bottom Layer w0.254: U11.7 19.5,49.55 R91.1
DPS_SCL: length 50.6
  Top Layer w0.155: U32.1 77.96,8.71 77.67,8.99 v2(77.24,8.99) 77.24,7.64 R128.2 ; R131.1 63.58,8.08 64.73,8.08 v2(64.73,8.99) ; 49.4,26.35 49.98,26.35 v2(50.06,26.26)
  Inner3 w0.155: v2(77.24,8.99) v2(64.73,8.99) 51.05,8.99 50.06,9.98 v2(50.06,26.26)
DPS_SDA: length 53.1
  Top Layer w0.155: v2(50.06,27.05) 49.97,27.15 49.4,27.15 ; R132.2 63.8,6.47 64.06,6.73 64.06,7.31 64.18,7.44 65.32,7.44 65.51,7.62 v2(65.51,9.6) ; U32.16 78.08,9.22 77.7,9.6 v2(75.82,9.6) 75.82,7.66 R127.1
  Inner3 w0.155: v2(75.82,9.6) v2(65.51,9.6) 52.07,9.6 50.8,10.87 50.8,26.7 50.44,27.05 v2(50.06,27.05)
FMC_A16: length 32.6
  Top Layer w0.155: v2(63.85,22.75) 65.45,22.75 FPC1.10 ; v2(63.77,34.2) 52.39,34.2 51.33,33.15 51.33,29.62 50.85,29.13 48.99,29.13 U1.G9
  Bottom Layer w0.155: v2(63.85,22.75) 63.85,34.13 v2(63.77,34.2)
FMC_D0: length 32.6
  Top Layer w0.155: U1.H8 48.07,27.68 v2(48.08,27.68) ; v2(60.87,26.25) 65.45,26.25 FPC1.17
  Bottom Layer w0.155: v2(48.08,27.68) 50.73,27.68 50.86,27.55 50.86,24.86 51.28,24.44 51.59,24.44 arc(51.77,24.51) 51.85,24.69 51.85,25.04 arc(52.1,25.3) 52.35,25.04 52.35,24.69 arc(52.61,24.44) 52.86,24.69 52.86,25.04 arc(53.12,25.3) 53.37,25.04 53.37,24.69 arc(53.62,24.44) 53.88,24.69 53.88,25.04 arc(54.13,25.3) 54.39,25.04 54.39,24.69 arc(54.64,24.44) 54.89,24.69 54.89,25.04 arc(55.15,25.3) 55.4,25.04 55.4,24.69 arc(55.66,24.44) 55.91,24.69 55.91,25.04 arc(56.16,25.3) 56.42,25.04 56.42,24.69 arc(56.67,24.44) 56.93,24.69 56.93,25.04 arc(57.18,25.3) 57.43,25.04 57.43,24.69 arc(57.69,24.44) 57.94,24.69 57.94,25.04 arc(58.2,25.3) 58.45,25.04 58.45,24.69 arc(58.7,24.44) 58.96,24.69 58.96,25.04 arc(59.21,25.3) 59.47,25.04 59.47,24.69 arc(59.54,24.51) 59.72,24.44 60.43,24.44 60.87,24.88 v2(60.87,26.25)
FMC_D1: length 32.7
  Top Layer w0.155: v2(61.66,26.73) 65.44,26.73 FPC1.18 ; v2(48.08,29.03) 48.08,29.02 U1.G8
  Bottom Layer w0.155: v2(48.08,29.03) 51.14,29.03 52.38,27.79 52.73,27.79 arc(52.91,27.86) 52.98,28.04 52.98,28.35 arc(53.24,28.6) 53.49,28.35 53.49,28.04 arc(53.57,27.86) 53.75,27.79 54.31,27.79 54.69,27.41 55.25,27.41 arc(55.43,27.48) 55.5,27.66 55.5,28.63 arc(55.75,28.88) 56.01,28.63 56.01,27.66 arc(56.26,27.41) 56.52,27.66 56.52,28.63 arc(56.77,28.88) 57.03,28.63 57.03,27.66 arc(57.28,27.41) 57.53,27.66 57.53,28.63 arc(57.79,28.88) 58.04,28.63 58.04,27.66 arc(58.29,27.41) 58.55,27.66 58.55,28.63 arc(58.8,28.88) 59.06,28.63 59.06,27.66 arc(59.31,27.41) 59.56,27.66 59.56,28.63 arc(59.82,28.88) 60.07,28.63 60.07,27.66 arc(60.15,27.48) 60.33,27.41 61.29,27.41 61.66,27.04 v2(61.66,26.73)
FMC_D2: length 32.7
  Top Layer w0.155: U1.D8 48.03,31.38 v2(48.08,31.38) ; v2(62.5,27.25) 65.45,27.25 FPC1.19
  Bottom Layer w0.155: v2(48.08,31.38) 48.17,31.47 52.83,31.47 53.57,30.73 54.44,30.73 arc(54.62,30.81) 54.69,30.99 54.69,31.6 arc(54.94,31.85) 55.2,31.6 55.2,30.99 arc(55.45,30.73) 55.71,30.99 55.71,31.6 arc(55.96,31.85) 56.21,31.6 56.21,30.99 arc(56.47,30.73) 56.72,30.99 56.72,31.6 arc(56.98,31.85) 57.23,31.6 57.23,30.99 arc(57.48,30.73) 57.74,30.99 57.74,31.6 arc(57.99,31.85) 58.25,31.6 58.25,30.99 arc(58.5,30.73) 58.75,30.99 58.75,31.6 arc(59.01,31.85) 59.26,31.6 59.26,30.99 arc(59.34,30.81) 59.52,30.73 59.82,30.73 60,30.56 60,29.82 60.22,29.59 60.75,29.59 arc(60.93,29.52) 61,29.34 61,28.37 arc(61.25,28.12) 61.51,28.37 61.51,29.34 arc(61.58,29.52) 61.76,29.59 62.23,29.59 62.5,29.32 v2(62.5,27.25)
FMC_D3: length 32.5
  Top Layer w0.155: FPC1.20 65.45,27.75 v2(62.08,27.75) ; v2(48.05,30.6) 48.05,30.6 U1.E8
  Bottom Layer w0.155: v2(62.08,27.75) 62.07,27.76 60.76,27.76 60.56,27.96 60.56,28.9 60.27,29.18 59.75,29.18 arc(59.57,29.26) 59.5,29.44 59.5,30.12 arc(59.24,30.38) 58.99,30.12 58.99,29.44 arc(58.74,29.18) 58.48,29.44 58.48,30.12 arc(58.23,30.38) 57.97,30.12 57.97,29.44 arc(57.72,29.18) 57.47,29.44 57.47,30.12 arc(57.21,30.38) 56.96,30.12 56.96,29.44 arc(56.7,29.18) 56.45,29.44 56.45,30.12 arc(56.2,30.38) 55.94,30.12 55.94,29.44 arc(55.69,29.18) 55.43,29.44 55.43,30.12 arc(55.18,30.38) 54.93,30.12 54.93,29.44 arc(54.67,29.18) 54.42,29.44 54.42,30.12 arc(54.16,30.38) 53.91,30.12 53.91,29.44 arc(53.84,29.26) 53.66,29.18 53.09,29.18 52.83,29.44 52.83,30.91 52.58,31.17 48.62,31.17 v2(48.05,30.6)
FMC_D4: length 32.7
  Top Layer w0.155: 45.4,27.95 45.4,27.95 v2(45.15,27.7) ; v2(45.38,21.57) 59.29,21.57 60.02,22.3 60.02,27.89 60.38,28.25 FPC1.21
  Bottom Layer w0.155: v2(45.15,27.7) 45.38,27.48 v2(45.38,21.57)
FMC_D5: length 32.6
  Top Layer w0.155: FPC1.22 59.86,28.75 59.49,28.37 59.49,22.45 59.11,22.07 48.18,22.07 arc(48.01,22.14) 47.94,22.31 arc(47.87,22.48) 47.71,22.55 47.67,22.55 arc(47.5,22.48) 47.44,22.31 arc(47.37,22.14) 47.2,22.07 47.16,22.07 arc(47,22.14) 46.93,22.31 arc(46.86,22.48) 46.69,22.55 46.66,22.55 arc(46.49,22.48) 46.42,22.31 arc(46.35,22.14) 46.18,22.07 45.72,22.07 45,22.79 45,26.75 45.4,27.15
FMC_D6: length 32.8
  Top Layer w0.155: FPC1.23 59.63,29.25 59.08,28.7 59.08,22.81 58.7,22.43 53.14,22.43 52.58,22.99 52.28,22.99 arc(52.1,22.91) 52.03,22.73 52.03,22.63 arc(51.77,22.38) 51.52,22.63 51.52,22.73 arc(51.26,22.99) 51.01,22.73 51.01,22.63 arc(50.76,22.38) 50.5,22.63 50.5,22.73 arc(50.25,22.99) 49.99,22.73 49.99,22.63 arc(49.74,22.38) 49.49,22.63 49.49,22.73 arc(49.23,22.99) 48.98,22.73 48.98,22.63 arc(48.72,22.38) 48.47,22.63 48.47,22.73 arc(48.4,22.91) 48.22,22.99 45.92,22.99 45.4,23.5 45.4,26.35
FMC_D7: length 32.7
  Top Layer w0.155: FPC1.24 59.44,29.75 58.6,28.91 58.6,23.9 58.17,23.47 57.57,23.47 arc(57.39,23.4) 57.31,23.22 57.31,22.99 arc(57.06,22.73) 56.81,22.99 56.81,23.22 arc(56.55,23.47) 56.3,23.22 56.3,22.99 arc(56.04,22.73) 55.79,22.99 55.79,23.22 arc(55.54,23.47) 55.28,23.22 55.28,22.99 arc(55.03,22.73) 54.77,22.99 54.77,23.22 arc(54.7,23.4) 54.52,23.47 v2(47.03,23.47) ; v2(46.5,28.43) 46.5,28.45 U1.G6
  Bottom Layer w0.155: v2(46.5,28.43) 46.66,28.27 46.66,23.84 v2(47.03,23.47)
FMC_D8: length 32.6
  Top Layer w0.155: v2(46,27.65) 46.2,27.85 U1.H6 ; FPC1.25 58.78,30.25 58.22,29.69 58.22,24.21 57.94,23.93 v2(57.51,23.93)
  Bottom Layer w0.155: v2(46,27.65) 46.2,27.45 46.2,23.32 46.66,22.86 48.23,22.86 49.3,23.93 49.72,23.93 arc(49.88,23.86) 49.95,23.7 arc(50.01,23.54) 50.17,23.47 50.23,23.47 arc(50.39,23.54) 50.46,23.7 arc(50.52,23.86) 50.68,23.93 50.74,23.93 arc(50.9,23.86) 50.96,23.7 arc(51.03,23.54) 51.19,23.47 51.24,23.47 arc(51.4,23.54) 51.47,23.7 arc(51.54,23.86) 51.7,23.93 51.75,23.93 arc(51.91,23.86) 51.98,23.7 arc(52.05,23.54) 52.21,23.47 52.26,23.47 arc(52.42,23.54) 52.49,23.7 arc(52.55,23.86) 52.71,23.93 52.77,23.93 arc(52.93,23.86) 53,23.7 arc(53.06,23.54) 53.22,23.47 53.28,23.47 arc(53.44,23.54) 53.5,23.7 arc(53.57,23.86) 53.73,23.93 v2(57.51,23.93)
FMC_D9: length 32.5
  Top Layer w0.155: U1.J6 45.8,26.75 45.8,24.95 46.4,24.36 57.33,24.36 57.86,24.89 57.86,25.21 arc(57.79,25.39) 57.61,25.46 57.35,25.46 arc(57.1,25.72) 57.35,25.97 57.61,25.97 arc(57.86,26.22) 57.61,26.48 57.35,26.48 arc(57.1,26.73) 57.35,26.99 57.61,26.99 arc(57.86,27.24) 57.61,27.5 57.35,27.5 arc(57.1,27.75) 57.35,28 57.61,28 arc(57.86,28.26) 57.61,28.51 57.35,28.51 arc(57.1,28.77) 57.35,29.02 57.61,29.02 arc(57.79,29.09) 57.86,29.27 57.86,30.51 58.1,30.75 FPC1.26
FMC_D10: length 32.7
  Top Layer w0.155: U1.K6 46.2,25.28 46.76,24.71 56.26,24.71 56.69,25.15 56.69,25.93 arc(56.62,26.11) 56.44,26.18 55.93,26.18 arc(55.68,26.44) 55.93,26.69 56.44,26.69 arc(56.69,26.95) 56.44,27.2 55.93,27.2 arc(55.68,27.45) 55.93,27.71 56.44,27.71 arc(56.69,27.96) 56.44,28.22 55.93,28.22 arc(55.68,28.47) 55.93,28.72 56.44,28.72 arc(56.62,28.8) 56.69,28.98 56.69,29.28 arc(56.77,29.46) 56.95,29.53 57.35,29.53 arc(57.6,29.78) 57.35,30.04 56.95,30.04 arc(56.77,30.11) 56.69,30.29 56.69,30.71 57.24,31.25 FPC1.27
FMC_D11: length 32.6
  Top Layer w0.155: v2(55.12,26.49) 55.12,29.66 55.13,29.68 arc(55.2,29.86) 55.38,29.93 55.96,29.93 arc(56.21,30.18) 55.96,30.44 55.38,30.44 arc(55.2,30.51) 55.13,30.69 55.13,31.15 55.73,31.75 FPC1.28 ; v2(47.25,28.5) 47.25,28.5 47,28.75
  Bottom Layer w0.155: v2(47.25,28.5) 49.45,28.5 49.94,28.02 50.8,28.02 51.16,27.66 51.16,25.98 51.51,25.63 57.25,25.63 57.4,25.78 57.4,26.34 57.25,26.49 v2(55.12,26.49)
FMC_D12: length 32.7
  Top Layer w0.155: v2(47.68,25.15) 47.7,25.12 55.73,25.12 55.96,25.35 55.96,25.68 55.75,25.89 54.81,25.89 54.64,26.07 54.64,26.41 arc(54.56,26.59) 54.38,26.67 54,26.67 arc(53.75,26.92) 54,27.18 54.38,27.18 arc(54.64,27.43) 54.38,27.68 54,27.68 arc(53.75,27.94) 54,28.19 54.38,28.19 arc(54.56,28.27) 54.64,28.45 54.64,31.8 55.08,32.25 FPC1.29 ; v2(47.28,27.68) 47.27,27.68 47,27.95
  Bottom Layer w0.155: v2(47.68,25.15) 47.69,25.16 47.69,27.27 v2(47.28,27.68)
FMC_D13: length 32.6
  Top Layer w0.155: FPC1.30 53.7,32.75 53.42,32.46 53.42,32.38 arc(53.49,32.2) 53.67,32.13 54.12,32.13 arc(54.38,31.88) 54.12,31.62 53.67,31.62 arc(53.42,31.37) 53.67,31.11 54.12,31.11 arc(54.38,30.86) 54.12,30.61 53.67,30.61 arc(53.42,30.35) 53.67,30.1 54.12,30.1 arc(54.38,29.84) 54.12,29.59 53.67,29.59 arc(53.42,29.33) 53.67,29.08 54.12,29.08 arc(54.38,28.83) 54.12,28.57 53.67,28.57 arc(53.49,28.5) 53.42,28.32 53.42,26.62 53.67,26.36 54.03,26.36 54.25,26.14 54.25,25.73 54.03,25.5 52.98,25.5 arc(52.8,25.58) 52.73,25.76 52.73,25.91 arc(52.47,26.16) 52.22,25.91 52.22,25.76 arc(52.15,25.58) 51.97,25.5 49.05,25.5 48.6,25.95 U1.K9
FMC_D14: length 32.6
  Top Layer w0.155: FPC1.31 53.16,33.25 53.01,33.09 53.01,32.66 arc(52.94,32.48) 52.76,32.41 52.4,32.41 arc(52.15,32.15) 52.4,31.9 52.76,31.9 arc(53.01,31.64) 52.76,31.39 52.4,31.39 arc(52.15,31.14) 52.4,30.88 52.76,30.88 arc(53.01,30.63) 52.76,30.38 52.4,30.38 arc(52.15,30.12) 52.4,29.87 52.76,29.87 arc(53.01,29.61) 52.76,29.36 52.4,29.36 arc(52.15,29.11) 52.4,28.85 52.76,28.85 arc(52.94,28.78) 53.01,28.6 53.01,27.81 52.72,27.53 52.46,27.53 arc(52.28,27.45) 52.21,27.27 52.21,26.65 arc(51.96,26.4) 51.7,26.65 51.7,27.27 arc(51.45,27.53) 51.19,27.27 51.19,26.01 arc(50.94,25.76) 50.69,26.01 50.69,27.27 arc(50.61,27.45) 50.43,27.53 48.98,27.53 U1.J9
FMC_D15: length 32.7
  Top Layer w0.155: v2(57.33,33.76) 52.83,33.76 51.77,32.7 51.77,28.13 51.66,28.02 50.19,28.02 49.86,28.35 49,28.35 U1.H9 ; v2(62.94,33.73) 62.96,33.75 FPC1.32
  Bottom Layer w0.155: v2(62.94,33.73) 62.94,34.16 62.69,34.42 61.96,34.42 arc(61.78,34.34) 61.7,34.16 61.7,33.27 arc(61.45,33.02) 61.19,33.27 61.19,34.16 arc(60.94,34.42) 60.69,34.16 60.69,33.27 arc(60.43,33.02) 60.18,33.27 60.18,34.16 arc(59.92,34.42) 59.67,34.16 59.67,33.27 arc(59.42,33.02) 59.16,33.27 59.16,34.16 arc(58.91,34.42) 58.65,34.16 58.65,33.27 arc(58.4,33.02) 58.15,33.27 58.15,34.16 arc(58.07,34.34) 57.89,34.42 57.56,34.42 57.33,34.19 v2(57.33,33.76)
FMC_NE1: length 32.7
  Top Layer w0.155: U1.D6 46.45,31.4 v2(46.45,31.4) ; FPC1.9 65.45,22.25 v2(63.37,22.25)
  Bottom Layer w0.155: v2(63.37,22.25) 63.37,32.13 62.89,32.61 55.23,32.61 arc(55.09,32.67) 55.03,32.82 arc(54.97,32.96) 54.83,33.02 54.73,33.02 arc(54.58,32.96) 54.52,32.82 arc(54.46,32.67) 54.32,32.61 53.01,32.61 51.61,34.01 47.09,34.01 46.45,33.37 v2(46.45,31.4)
FMC_NOE: length 32.5
  Top Layer w0.155: FPC1.12 65.45,23.75 v2(62.95,23.75) ; v2(47.25,31.4) 47.25,31.4 47,31.15
  Bottom Layer w0.155: v2(47.25,31.4) 47.65,31.8 53.7,31.8 54,32.11 60.24,32.11 arc(60.42,32.03) 60.49,31.85 60.49,30.78 arc(60.74,30.53) 61,30.78 61,31.85 arc(61.25,32.11) 61.51,31.85 61.51,30.78 arc(61.76,30.53) 62.01,30.78 62.01,31.85 arc(62.09,32.03) 62.27,32.11 62.74,32.11 62.95,31.89 v2(62.95,23.75)
FMC_NWE: length 32.7
  Top Layer w0.155: v2(46.6,34.97) 46.6,33.15 U1.B6 ; v2(64.29,23.25) 65.45,23.25 FPC1.11
  Bottom Layer w0.155: v2(46.6,34.97) 63.79,34.97 64.26,34.49 64.26,23.28 v2(64.29,23.25)
GPS_ON: length 37.3
  Top Layer w0.155: 47,33.55 v2(47,38.65) ; U30.5 70.44,47.73 v2(68.83,47.73)
  Bottom Layer w0.155: v2(68.83,47.73) 47.65,47.73 47,47.08 v2(47,38.65)
GPS_RST: length 33.4
  Top Layer w0.155: U1.A6 v2(46.2,38.13) ; U30.9 70.44,43.33 v2(69.36,43.33)
  Bottom Layer w0.155: v2(69.36,43.33) 48.48,43.33 47.73,42.58 47.73,38.5 47.35,38.13 v2(46.2,38.13)
GPS_RX: length 41.4
  Top Layer w0.155: U30.3 70.44,49.93 v2(68.83,49.93) ; 45.4,32.75 45.8,33.15 45.8,38.45 v2(46.08,38.73)
  Bottom Layer w0.155: v2(46.08,38.73) 46.08,49.25 46.75,49.93 v2(68.83,49.93)
GPS_TX: length 42.3
  Top Layer w0.155: U30.2 70.45,51.05 v2(68.8,51.05) ; 45.4,33.55 v2(45.4,38.73)
  Bottom Layer w0.155: v2(68.8,51.05) 45.9,51.05 45.4,50.55 v2(45.4,38.73)
IST_RST: length 50.5
  Top Layer w0.155: 45.4,28.75 45.65,28.5 v2(45.67,28.5) ; U32.14 74.26,10.22 72.75,11.73 v2(46.46,11.73)
  Inner3 w0.155: v2(46.46,11.73) 46.46,25.02 45.59,25.88 45.59,28.42 v2(45.67,28.5)
LIGHT: length 39.6
  Top Layer w0.155: R116.1 35.69,53.53 R115.1 ; 43,27.95 42.75,27.69 v2(42.75,27.69)
  Inner2 w0.155: v2(42.75,27.69) 42.75,26.92 42.32,26.49 35.51,26.49 34.95,27.05 34.95,50.55 35.74,51.33 R115.1
LIGHT_CL1: length 46.9
  Top Layer w0.155: v2(33.88,48.74) 44.49,48.74 44.75,49 FPC3.4 ; U1.K4 v2(44.6,25.15)
  Inner2 w0.155: v2(44.6,25.15) 44.58,25.12 34.77,25.12 33.86,26.03 33.86,48.72 v2(33.88,48.74)
LIGHT_CL2: length 51.7
  Top Layer w0.155: FPC3.5 45.25,48.67 44.77,48.2 v2(33.25,48.2) ; U1.J4 44.35,27.4 v2(44.35,27.41)
  Inner2 w0.155: v2(33.25,48.2) 33.25,25.48 34.14,24.59 44.83,24.59 45.09,24.84 45.09,26.67 v2(44.35,27.41)
MPU_INT: length 50.2
  Top Layer w0.155: R29.1 15.52,28.14 15.37,27.99 15.37,25.21 15.89,24.69 28.41,24.69 29.08,25.35 29.08,37.55 29.58,38.05 43.08,38.05 43.4,37.73 43.4,33.15 U1.B3
MPU_SCL: length 32.8
  Top Layer w0.155: R22.2 27.42,29.05 28.25,29.05 28.53,29.33 28.53,37.93 29.08,38.48 43.65,38.48 44.2,37.93 44.2,33.15 U1.B4
  Top Layer w0.157: R24.1 27.4,29.02 27.37,29.05
MPU_SDA: length 30.2
  Top Layer w0.155: U1.A4 44.6,38.25 43.93,38.93 28.08,38.93 27.4,38.24 R23.1
  Top Layer w0.157: R21.2 R23.1
OSC_IN: length 6.6
  Top Layer w0.155: C23.1 37.6,33.85 X3.1 37.6,32.3 38.12,31.78 42.03,31.78 U1.C1
OSC_OUT: length 5
  Top Layer w0.155: U1.D1 38.6,31.15 X3.3 38.61,31.09 C24.2
PA0: length 37.6
  Top Layer w0.155: v2(42.75,28.5) 42.75,28.5 43,28.75
  Inner3 w0.155: 71.86,32.06 63.83,32.06 60.48,35.41 45.82,35.41 45.21,34.8 45.21,29.95 44.4,29.13 43.38,29.13 v2(42.75,28.5)
  Bottom Layer w0.155: 71.86,32.06 71.9,32.1 FPC4.15
  vias: v2(71.86,32.09)
PA4: length 37
  Top Layer w0.155: v2(43.56,28.47) 43.56,28.51 U1.G3
  Inner2 w0.155: v2(71.86,31.09) 63.5,31.09 61.9,32.69 61.9,33.93 61.34,34.49 45.75,34.49 45.24,33.98 45.24,29.34 44.86,28.96 44.04,28.96 v2(43.56,28.47)
  Bottom Layer w0.155: v2(71.86,31.09) 72.87,31.09 FPC4.17
PA5: length 44.1
  Top Layer w0.155: U1.H3 43.54,27.69 v2(43.49,27.69) ; R113.2 30.13,47.87 31.93,46.08 v2(34.42,46.08)
  Inner2 w0.155: v2(34.42,46.08) 34.42,26.34 35.13,25.63 43.03,25.63 43.49,26.09 v2(43.49,27.69)
PA9: length 23.6
  Top Layer w0.155: 61.3,43.61 58.32,43.61 57.61,42.9 57.61,40.28 56.92,39.6 50.7,39.6 50.16,39.06 50.16,31.87 49.84,31.55 49,31.55 U1.C9
PA10: length 39.1
  Top Layer w0.155: v2(49.86,30.68) 49.86,30.69 49.4,31.15
  Inner3 w0.155: v2(49.86,30.68) 51.23,30.68 51.89,30.02 51.89,20.83 52.48,20.24 71.88,20.24 72.14,19.99 v2(72.14,18.75)
  Bottom Layer w0.155: v2(72.14,18.75) 77.28,18.75 FPC2.4
PA11: length 40.8
  Top Layer w0.155: v2(49.68,32.19) 49.65,32.19 49.4,31.95
  Inner3 w0.155: v2(49.68,32.19) 52.11,32.19 52.88,31.42 52.88,21.54 53.62,20.8 72.47,20.8 72.9,20.37 v2(72.9,18.24)
  Bottom Layer w0.155: FPC2.5 77.28,18.24 v2(72.9,18.24)
PA13: length 59.7
  Top Layer w0.155: 49.4,33.55 49.4,39.03 48.7,39.73 27.03,39.73 26.49,39.19 26.49,34.47 26.16,34.14 13.49,34.14 13,33.66 13,29.34 12.45,28.79 9.93,28.79
  Top Layer w0.157: 8.48,28.75 8.51,28.72 8.51,27.89 8.37,27.75 USB1.7 ; 8.48,28.75 USB1.5 ; 8.48,28.75 9.89,28.75 9.93,28.79
PA14: length 59.9
  Top Layer w0.155: U1.A9 48.6,38.35 47.6,39.35 27.74,39.35 26.95,38.56 26.95,33.86 26.49,33.4 14.43,33.4 13.97,32.94 13.97,27.94 13.26,27.23 9.95,27.23 R10.1
  Top Layer w0.157: USB1.6 6.56,28.25 6.4,28.09 6.4,27.41 6.58,27.23 9.91,27.23 R10.1
PB5: length 30.7
  Top Layer w0.155: v2(45.82,32.33) 45.79,32.33 45.4,31.95
  Inner3 w0.155: v2(71.37,31.6) 63.32,31.6 60.45,34.47 46.25,34.47 45.82,34.04 v2(45.82,32.33)
  Bottom Layer w0.155: FPC4.16 72.88,31.6 v2(71.37,31.6)
PB10: length 38.8
  Top Layer w0.155: 47,27.15 47.29,26.85 v2(47.29,26.85)
  Inner2 w0.155: v2(47.29,26.85) 46.86,26.85 46.51,26.49 46.51,24.84 45.76,24.09 13.07,24.09 v2(13.06,24.1)
  Bottom Layer w0.155: v2(13.06,24.1) 13.06,22.06 U26.2
PB11: length 35.3
  Top Layer w0.155: 47,26.35 47,25.64 v2(47.12,25.53)
  Inner2 w0.155: v2(47.12,25.53) 47.12,24.46 46.2,23.55 v2(15.62,23.55)
  Bottom Layer w0.155: U26.3 15.62,22.07 v2(15.62,23.55)
PB15: length 32.6
  Top Layer w0.155: v2(50.4,28.58) 50.23,28.75 49.4,28.75 ; v2(61.29,25.25) 62.02,25.25 arc(62.2,25.33) 62.27,25.5 62.27,25.61 arc(62.53,25.86) 62.78,25.61 62.78,25.5 arc(63.04,25.25) 63.29,25.5 63.29,25.61 arc(63.54,25.86) 63.8,25.61 63.8,25.5 arc(63.87,25.33) 64.05,25.25 65.45,25.25 FPC1.15
  Bottom Layer w0.155: v2(61.29,25.25) 61.27,25.27 61.27,26.77 60.99,27.05 59.95,27.05 arc(59.77,26.98) 59.69,26.8 59.69,25.82 arc(59.44,25.56) 59.19,25.82 59.19,26.8 arc(58.93,27.05) 58.68,26.8 58.68,25.82 arc(58.42,25.56) 58.17,25.82 58.17,26.8 arc(58.09,26.98) 57.91,27.05 54.84,27.05 54.58,26.8 54.58,26.14 54.43,25.98 54.21,25.98 arc(54.03,26.06) 53.96,26.24 53.96,27.25 arc(53.7,27.51) 53.45,27.25 53.45,26.24 arc(53.2,25.98) 52.94,26.24 52.94,27.25 arc(52.69,27.51) 52.43,27.25 52.43,26.24 arc(52.36,26.06) 52.18,25.98 51.71,25.98 51.54,26.16 51.54,27.99 50.95,28.58 v2(50.4,28.58)
PC1: length 38
  Top Layer w0.155: 43,29.55 42.75,29.79 v2(42.75,29.79)
  Inner2 w0.155: v2(42.75,29.79) 43.15,30.2 43.15,30.86 42.72,31.29 42.72,32.33 42.27,32.79 42.27,35 43.13,35.86 64.01,35.86 66.29,33.58 71.37,33.58
  Bottom Layer w0.155: FPC4.12 72.85,33.58 71.37,33.58
  vias: v2(71.37,33.6)
PC2: length 39.6
  Top Layer w0.155: v2(42.72,30.61) 42.74,30.61 43,30.35
  Inner3 w0.155: v2(42.72,30.61) 42.72,32.31 42.32,32.72 42.32,36.75 43.23,37.67 49.22,37.67 50.29,38.73 52.38,38.73 54.08,37.03 66.85,37.03 68.81,35.08 71.86,35.08
  Bottom Layer w0.155: 71.86,35.08 71.88,35.1 FPC4.9
  vias: v2(71.86,35.09)
PC3: length 35.6
  Top Layer w0.155: U1.F3 43.56,29.79 v2(43.56,29.79)
  Inner2 w0.155: 71.86,33.07 65.96,33.07 63.63,35.41 44.6,35.41 43.99,34.8 43.99,30.23 v2(43.56,29.79)
  Bottom Layer w0.155: FPC4.13 71.89,33.1 71.86,33.07
  vias: v2(71.86,33.09)
PC4: length 43.2
  Top Layer w0.155: U1.G4 44.87,28.47
  Inner3 w0.155: v2(45.87,19.28) 45.87,24.87 44.75,25.98 44.75,28.02 44.87,28.14 v2(44.87,28.51)
  Bottom Layer w0.155: 72.67,20.89 72.67,19.31 72.65,19.28 ; FPC2.3 77.26,19.28 72.65,19.28 ; 72.65,19.28 v2(45.87,19.28)
PC5: length 45.2
  Top Layer w0.155: U1.H4 44.35,28.19 v2(44.35,28.19)
  Inner3 w0.155: v2(43.94,19.71) 43.94,27.79 v2(44.35,28.19)
  Bottom Layer w0.155: v2(43.94,19.71) 70.99,19.71 71.43,20.14 71.43,21.13 71.88,21.59 73.84,21.59 74.16,21.27 74.16,20.05 74.45,19.76 77.28,19.76 FPC2.2
PC6: length 66.7
  Top Layer w0.155: 49.4,29.55 50.45,29.55 50.98,30.07 v2(50.98,37.11) ; v2(10.77,32.87) 10.77,40.74 10.26,41.25 USB2.8 6.55,41.25 6.32,41.48 6.32,42.06 6.51,42.25 USB2.6
  Bottom Layer w0.155: v2(50.98,37.11) 26.62,37.11 26.14,36.63 26.14,33.88 25.12,32.87 v2(10.77,32.87)
PC7: length 65.8
  Top Layer w0.155: USB2.5 8.31,42.75 ; 8.31,42.75 8.31,42.74 8.31,41.88 8.17,41.75 USB2.7 ; 8.31,42.75 10.79,42.75 11.35,42.19 v2(11.35,33.63) ; 49.4,30.35 49.55,30.2 50.32,30.2 50.55,30.43 v2(50.55,37.67)
  Bottom Layer w0.155: v2(11.35,33.63) 24.89,33.63 25.5,34.24 25.5,37.21 25.96,37.67 v2(50.55,37.67)
PC8: length 42.8
  Top Layer w0.155: R20.1 33.55,17.86 v2(32.92,17.22) 32.92,15.42 32.96,15.38 ; v2(48.9,29.79) 48.85,29.79 U1.F9
  Inner2 w0.155: v2(32.92,17.22) 42.64,17.22 arc(42.82,17.3) 42.9,17.47 42.9,18.62 arc(43.15,18.87) 43.41,18.62 43.41,17.47 arc(43.66,17.22) 43.91,17.47 43.91,18.62 arc(44.17,18.87) 44.42,18.62 44.42,17.47 arc(44.68,17.22) 44.93,17.47 44.93,18.62 arc(45.18,18.87) 45.44,18.62 45.44,17.47 arc(45.69,17.22) 45.95,17.47 45.95,18.62 arc(46.2,18.87) 46.45,18.62 46.45,17.47 arc(46.53,17.3) 46.71,17.22 47.88,17.22 48.59,17.93 48.59,29.49 v2(48.9,29.79)
PC9: length 43
  Top Layer w0.155: R19.1 31.85,17.92 v2(31.85,16.76) 31.85,15.38 31.86,15.38 ; U1.E9 48.87,30.61 v2(48.87,30.63)
  Inner2 w0.155: v2(31.85,16.76) 49.61,16.76 50.39,17.55 50.39,18.5 arc(50.32,18.68) 50.14,18.75 49.25,18.75 arc(49,19.01) 49.25,19.26 50.14,19.26 arc(50.39,19.52) 50.14,19.77 49.25,19.77 arc(49,20.02) 49.25,20.28 50.14,20.28 arc(50.39,20.53) 50.14,20.78 49.25,20.78 arc(49,21.04) 49.25,21.29 50.14,21.29 arc(50.32,21.37) 50.39,21.55 50.39,22.02 50.01,22.4 49.68,22.4 49.4,22.68 49.4,30.1 v2(48.87,30.63)
PC10: length 45.1
  Top Layer w0.155: 39.56,15.11 v2(40.39,15.11) 40.39,16.41 41.47,17.49 R18.1 ; v2(48.84,32.99) 48.84,32.99 U1.B9
  Inner2 w0.155: v2(48.84,32.99) 50.57,32.99 51.16,32.41 51.16,15.75 50.52,15.11 50.02,15.11 arc(49.84,15.19) 49.76,15.37 49.76,15.65 arc(49.51,15.9) 49.25,15.65 49.25,15.37 arc(49,15.11) 48.75,15.37 48.75,15.65 arc(48.49,15.9) 48.24,15.65 48.24,15.37 arc(47.98,15.11) 47.73,15.37 47.73,15.65 arc(47.48,15.9) 47.22,15.65 47.22,15.37 arc(46.97,15.11) 46.71,15.37 46.71,15.65 arc(46.46,15.9) 46.21,15.65 46.21,15.37 arc(45.95,15.11) 45.7,15.37 45.7,15.65 arc(45.44,15.9) 45.19,15.65 45.19,15.37 arc(44.94,15.11) 44.68,15.37 44.68,15.65 arc(44.43,15.9) 44.17,15.65 44.17,15.37 arc(43.92,15.11) 43.67,15.37 43.67,15.65 arc(43.41,15.9) 43.16,15.65 43.16,15.37 arc(42.9,15.11) 42.65,15.37 42.65,15.65 arc(42.4,15.9) 42.14,15.65 42.14,15.37 arc(41.89,15.11) 41.63,15.37 41.63,15.65 arc(41.38,15.9) 41.13,15.65 41.13,15.37 arc(41.05,15.19) 40.87,15.11 v2(40.39,15.11)
PC11: length 45
  Top Layer w0.155: R17.1 39.93,17.55 38.46,16.08 38.46,15.38 ; U1.B8 48.07,33.02 v2(48.08,33.02) ; v2(38.46,14.17) CARD1.2
  Inner2 w0.155: v2(48.08,33.02) 48.59,33.53 51.03,33.53 51.54,33.02 51.54,14.38 51.33,14.17 50.73,14.17 arc(50.55,14.25) 50.47,14.43 50.47,14.58 arc(50.22,14.83) 49.97,14.58 49.97,14.43 arc(49.71,14.17) 49.46,14.43 49.46,14.58 arc(49.2,14.83) 48.95,14.58 48.95,14.43 arc(48.7,14.17) 48.44,14.43 48.44,14.58 arc(48.19,14.83) 47.93,14.58 47.93,14.43 arc(47.68,14.17) 47.43,14.43 47.43,14.58 arc(47.17,14.83) 46.92,14.58 46.92,14.43 arc(46.66,14.17) 46.41,14.43 46.41,14.58 arc(46.16,14.83) 45.9,14.58 45.9,14.43 arc(45.83,14.25) 45.65,14.17 v2(38.46,14.17)
PC12: length 43.3
  Top Layer w0.155: 35.16,15.38 35.15,15.38 v2(35.15,16.36) 35.15,18.02 R38.1 ; v2(47.52,32.2) 47.78,31.95 U1.C8
  Inner2 w0.155: v2(35.15,16.36) 50.14,16.36 50.83,17.04 50.83,22.76 arc(50.75,22.94) 50.57,23.01 49.94,23.01 arc(49.68,23.26) 49.94,23.52 50.57,23.52 arc(50.83,23.77) 50.57,24.03 49.94,24.03 arc(49.68,24.28) 49.94,24.53 50.57,24.53 arc(50.83,24.79) 50.57,25.04 49.94,25.04 arc(49.68,25.3) 49.94,25.55 50.57,25.55 arc(50.75,25.62) 50.83,25.8 50.83,32 50.24,32.59 47.91,32.59 v2(47.52,32.2)
PC13: length 39.5
  Top Layer w0.155: v2(41.83,36.27) 42.7,36.27 43,35.97 43,33.55
  Inner3 w0.155: v2(41.83,36.27) 41.83,39.12 42.6,39.88 53.14,39.88 55.14,37.87 67.67,37.87 69.44,36.09 v2(71.86,36.09)
  Bottom Layer w0.155: v2(71.86,36.09) 72.87,36.09 FPC4.7
PD2: length 44.7
  Top Layer w0.155: v2(47.27,33.02) 47.27,33.02 47,32.75 ; R37.1 38.38,17.51 37.36,16.48 37.36,15.38 37.36,15.37 v2(37.36,13.56)
  Inner2 w0.155: v2(47.27,33.02) 48.29,34.04 51.28,34.04 51.94,33.38 51.94,14.15 51.36,13.56 v2(37.36,13.56)
PE0: length 34.6
  Top Layer w0.155: v2(44.81,31.44) 44.81,31.35 U1.D4
  Inner3 w0.155: 71.37,32.59 65.41,32.59 64.47,33.53 64.47,35.03 63.7,35.79 45.52,35.79 44.81,35.08 v2(44.81,31.44)
  Bottom Layer w0.155: 71.37,32.59 72.86,32.59 FPC4.14
  vias: v2(71.37,32.6)
PE1: length 37.1
  Top Layer w0.155: U1.C4 45.01,32.35 45.01,38.56 v2(44.7,38.86)
  Inner3 w0.155: v2(71.37,35.61) 69.04,35.61 67.18,37.47 54.58,37.47 52.76,39.29 45.14,39.29 v2(44.7,38.86)
  Bottom Layer w0.155: v2(71.37,35.61) 71.38,35.6 FPC4.8
PE2: length 33.4
  Top Layer w0.155: U1.A3 v2(43.8,36.45)
  Inner3 w0.155: v2(43.8,36.45) 44.54,37.19 48.18,37.19 48.79,36.58 66.55,36.58 68.5,34.62 71.37,34.62
  Bottom Layer w0.155: FPC4.10 72.86,34.62 71.37,34.62
  vias: v2(71.37,34.61)
PE6: length 35.4
  Top Layer w0.155: v2(43.56,30.61) 43.56,30.59 U1.E3
  Inner3 w0.155: v2(43.56,30.61) 43.99,31.04 43.99,35.41 44.75,36.17 66.27,36.17 68.35,34.09 71.86,34.09
  Bottom Layer w0.155: 71.86,34.09 72.86,34.09 FPC4.11
  vias: v2(71.86,34.09)
